# Altium project Power_vac.PrjPcb (part 2 of 2)

## Sheet Filtr_220.SchDoc
size B; SheetNumber: 8; SheetTotal: 9
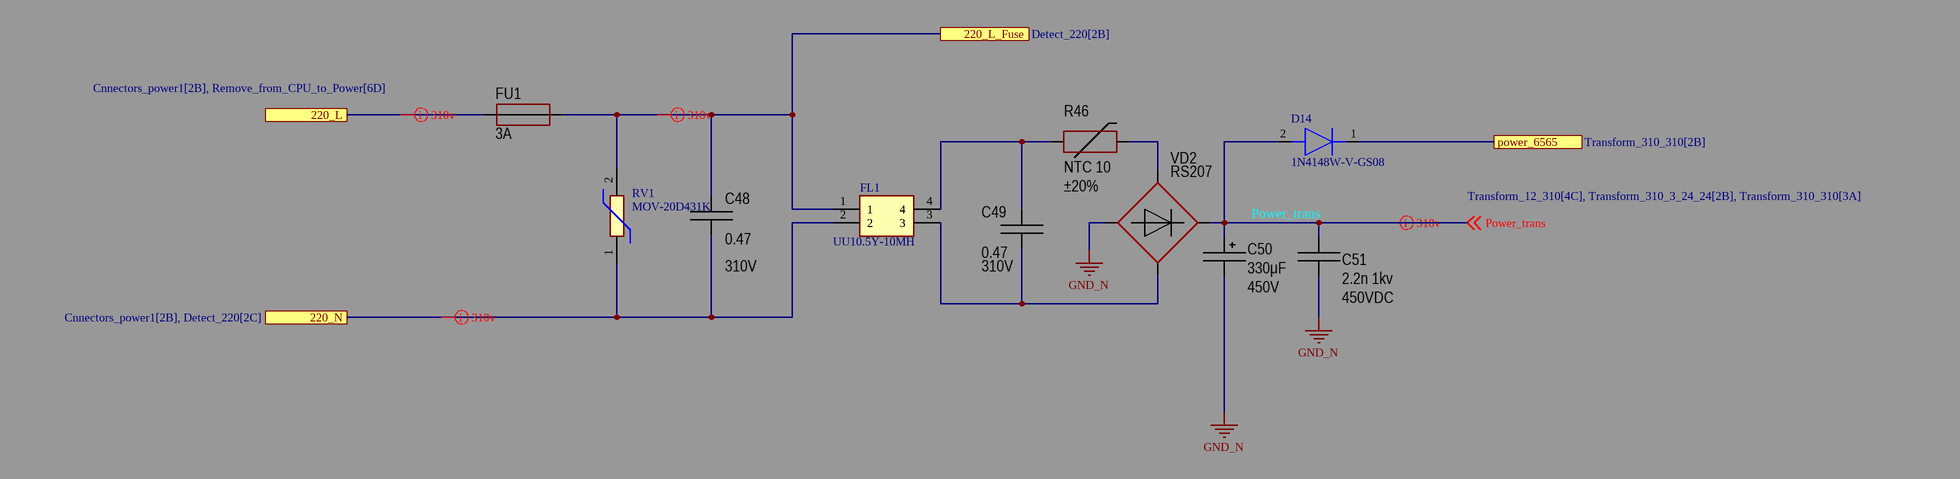
[diagram p7: Filtr_220.SchDoc]

### Parts
C48  value 0.47  Voltage: 310V  [CAP: B32922 (18x7x12.5mm)]
C49  value 0.47  Voltage: 310V  [CAP: B32922 (18x7x12.5mm)]
C50  value 330μF  Voltage: 450V  [CAP: D25C10H50]
C51  value 2.2n 1kv  Voltage: 450VDC  [CAP: AY2102M29Y5US63L7]
D14  1N4148W-V-GS08  [1N4148WVGS08]
FL1  UU10.5Y-10MH  [UU105Y10MH]
FU1  MaxCurrent: 3A  [FUSE: FC-001S]
R46  value NTC 10  Tolerance: ±20%  [RES: B57237 (NTC)]
RV1  MOV-20D431K  [MOV20D431K]
VD2  PartNumber: RS207  [DIODE: KBU6M]

### Ports
220_L (see Cnnectors_power1[2B], Remove_from_CPU_to_Power[6D]), 220_L_Fuse (see Detect_220[2B]), 220_N (see Cnnectors_power1[2B], Detect_220[2C]), power_6565 (see Transform_310_310[2B])

### Nets
GND_N: C50.2 C51.2 VD2.1
220_L: FU1.1 ; port 220_L
220_L_Fuse: C48.1 FL1.1 FU1.2 RV1.2 ; port 220_L_Fuse
220_N: C48.2 FL1.2 RV1.1 ; port 220_N
power_6565: D14.1(K) ; port power_6565
Power_trans: C50.1 C51.1 D14.2(A) VD2.3 ; off-sheet Power_trans
NetC49_1: C49.1 FL1.4 R46.1
NetC49_2: C49.2 FL1.3 VD2.4
NetR46_2: R46.2 VD2.2

### Layout directives
net class 310v: 220_L, 220_L_Fuse, 220_N, Power_trans

### Library data of the parts
C48 C49 = Film: Manufacturer: Epcos; PartNumber: B32774D4106K000; ValueManufacturerPartNumber: Film capacitor, 0.47, 310V, ±10%, 10.9mOhm, 31.5x15 mm, -40...+105°C; TypeCapacitor: Film capacitor; Tolerance: ±10%; Impedance: 10.9mOhm; Package: 31.5x15 mm; HelpURL: https://www.digikey.com/products/en/capacitors/film-capacitors/62?k=&pkeyword=&sv=0&pv2097=1958&sf=0&FV=fffc01ef%2C1f140000%2Cffe0003e%2Cffec6366&quantity=1&ColumnSort=1000011&page=1&stock=1&pageSize=25; Temperature: -40...+105°C
C50 = Aluminium: Manufacturer: Wurth; PartNumber: 860080475013; ValueManufacturerPartNumber: Aluminium capacitor, 330μF, 450V, ±20%, 54mOhm, 14x10x5 mm, -55...+105°C; TypeCapacitor: Aluminium capacitor; Tolerance: ±20%; Impedance: 54mOhm; Package: 14x10x5 mm; HelpURL: https://www.digikey.com/product-detail/en/wurth-electronics-inc/860080475013/732-9029-1-ND/5728972; Temperature: -55...+105°C
C51 = Film: Manufacturer: Epcos; PartNumber: B32774D4106K000; ValueManufacturerPartNumber: Film capacitor, 2.2n 1kv, 450VDC, ±10%, 10.9mOhm, 31.5x15 mm, -40...+105°C; TypeCapacitor: Film capacitor; Tolerance: ±10%; Impedance: 10.9mOhm; Package: 31.5x15 mm; HelpURL: https://www.digikey.com/products/en/capacitors/film-capacitors/62?k=&pkeyword=&sv=0&pv2097=1958&sf=0&FV=fffc01ef%2C1f140000%2Cffe0003e%2Cffec6366&quantity=1&ColumnSort=1000011&page=1&stock=1&pageSize=25; Temperature: -40...+105°C
D14 = 1N4148W-V-GS08: Diode; Manufacturer_Name: Vishay; Datasheet Link: https://us.rs-online.com/m/d/a2789c8794cb0c42ced29f2dd8571f3c.pdf; Height: 1.35mm; Manufacturer_Part_Number: 1N4148W-V-GS08; Mouser Part Number: 625-1N4148W-V; Mouser Price/Stock: https://www.mouser.co.uk/ProductDetail/Vishay-Semiconductors/1N4148W-V-GS08?qs=TNTIDjy6APrS%2Fdgq1RSs3A%3D%3D; Arrow Part Number: 1N4148W-V-GS08; Arrow Price/Stock: https://www.arrow.com/en/products/1n4148w-v-gs08/vishay
FL1 = UU10.5Y-10MH: Filter; Manufacturer_Name: FH(Guangdong Fenghua Advanced Tech); Datasheet Link: https://datasheet.lcsc.com/lcsc/2304140030_FH--Guangdong-Fenghua-Advanced-Tech-UU10-5Y-10mH_C75196.pdf; Height: 17mm; Manufacturer_Part_Number: UU10.5Y-10MH
FU1 = Fuse: Manufacturer: Littelfuse; PartNumber: 01110501Z; TypeFuse: Electromechanics relay; VoltageMax: 250VAC; Package: 5x20mm; HelpURL: https://www.digikey.com/products/en?keywords=01110501Z; ValueManufacturerPartNumber: =TypeFuse+', '+VoltageMax+', '+MaxCurrent+', '+Package+', '+Temperature
R46 = NTC: Manufacturer: Epcos; PartNumber: B57237S229M54; ValueManufacturerPartNumber: NTC resistor, NTC 10, ±20%, pitch 7.5mm, 7A, -55...+125°C; TypeResistor: NTC resistor; MaxCurrent: 7A; Package: pitch 7.5mm; HelpURL: https://www.digikey.com/product-detail/en/epcos-tdk/B57237S229M54/495-76635-1-ND/8126375; Temperature: -55...+125°C
RV1 = MOV-20D431K: Varistor; Manufacturer_Name: Bourns; Datasheet Link: https://www.bourns.com/data/global/pdfs/MOV20D.pdf; Height: 26mm; Manufacturer_Part_Number: MOV-20D431K; Mouser Part Number: 652-MOV-20D431K; Mouser Price/Stock: https://www.mouser.co.uk/ProductDetail/Bourns/MOV-20D431K?qs=CQ3B1E%252BbPs2R73OUL4kc5g%3D%3D; Arrow Part Number: MOV-20D431K; Arrow Price/Stock: https://www.arrow.com/en/products/mov-20d431k/bourns?utm_currency=USD&region=nac
VD2 = 1PH rectifier: Manufacturer: Comchip Technology; ValueManufacturerPartNumber: Single phase rectifier, 600V, 2A, 1.1V, 4-SMD, -55...+150°C; TypeDiode: Single phase rectifier; Voltage: 600V; Current: 2A; VoltageDrop: 1.1V; Package: 4-SMD; HelpURL: https://www.digikey.com/product-detail/en/comchip-technology/DF206ST-G/641-1425-1-ND/2208797; Temperature: -55...+150°C

## Sheet Remove_from_CPU_to_Power.SchDoc
size E; SheetNumber: 9; SheetTotal: 9
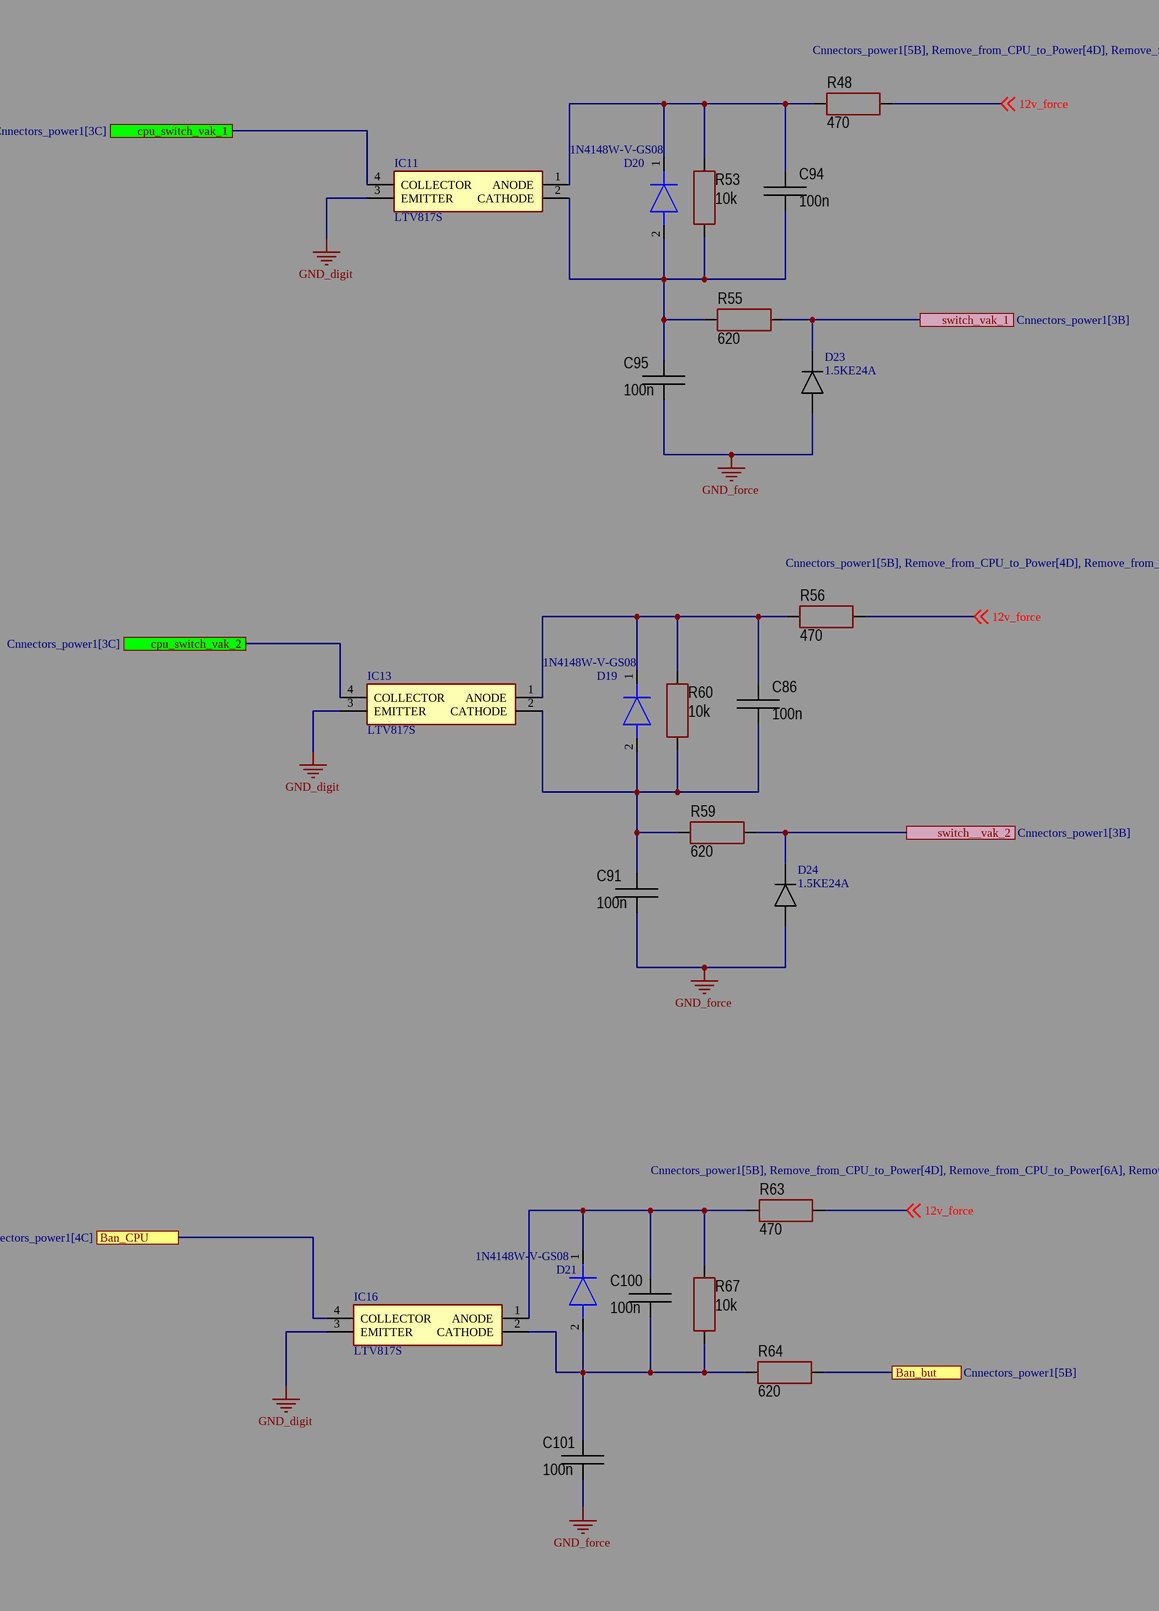
[diagram p8: Remove_from_CPU_to_Power.SchDoc, top left]
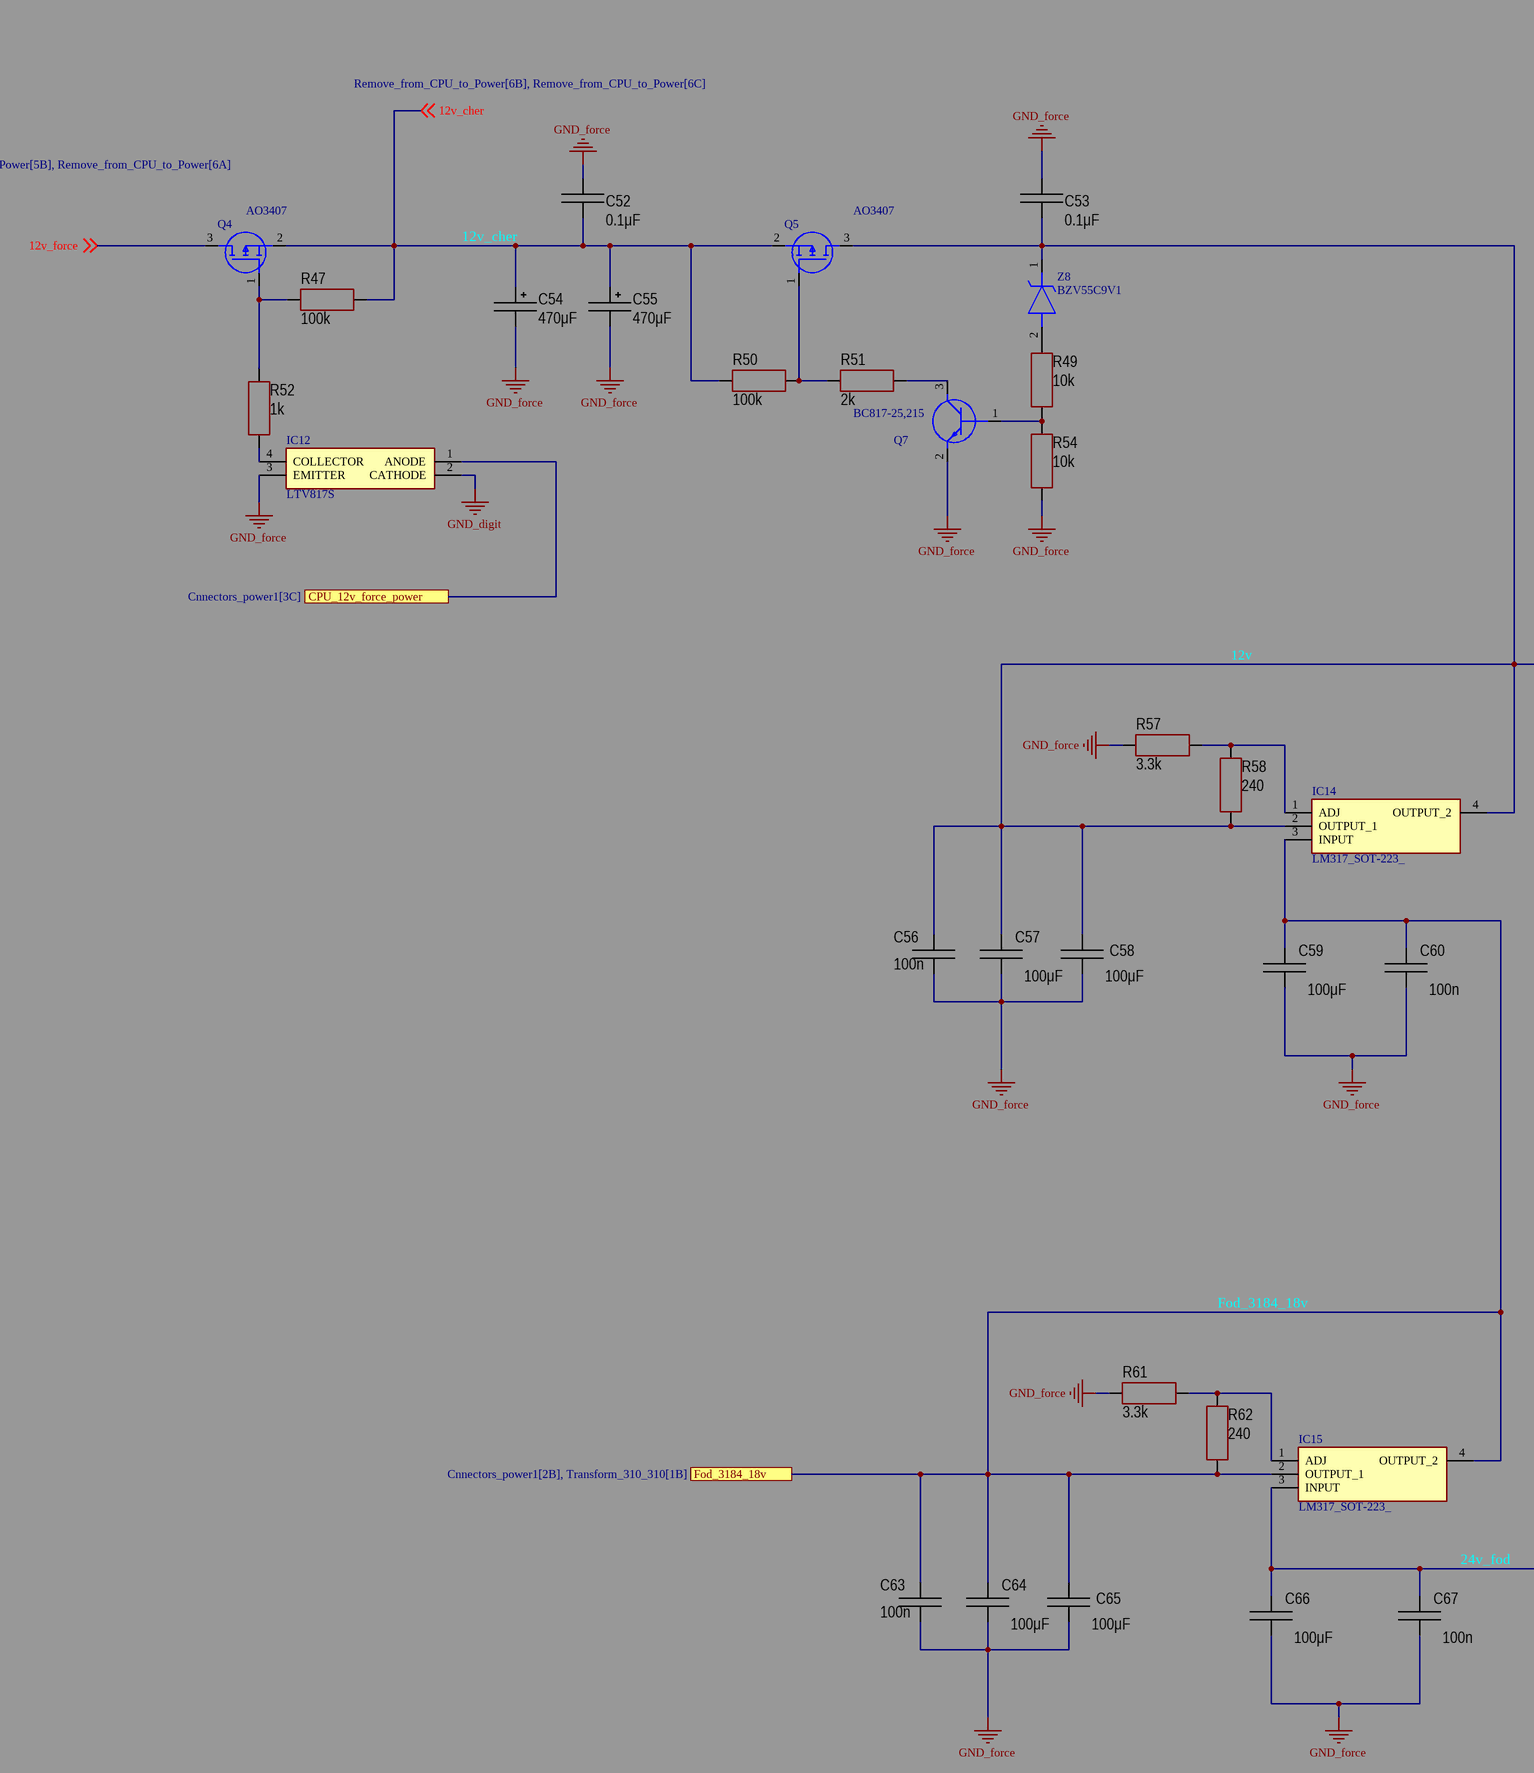
[diagram p9: Remove_from_CPU_to_Power.SchDoc, top middle]
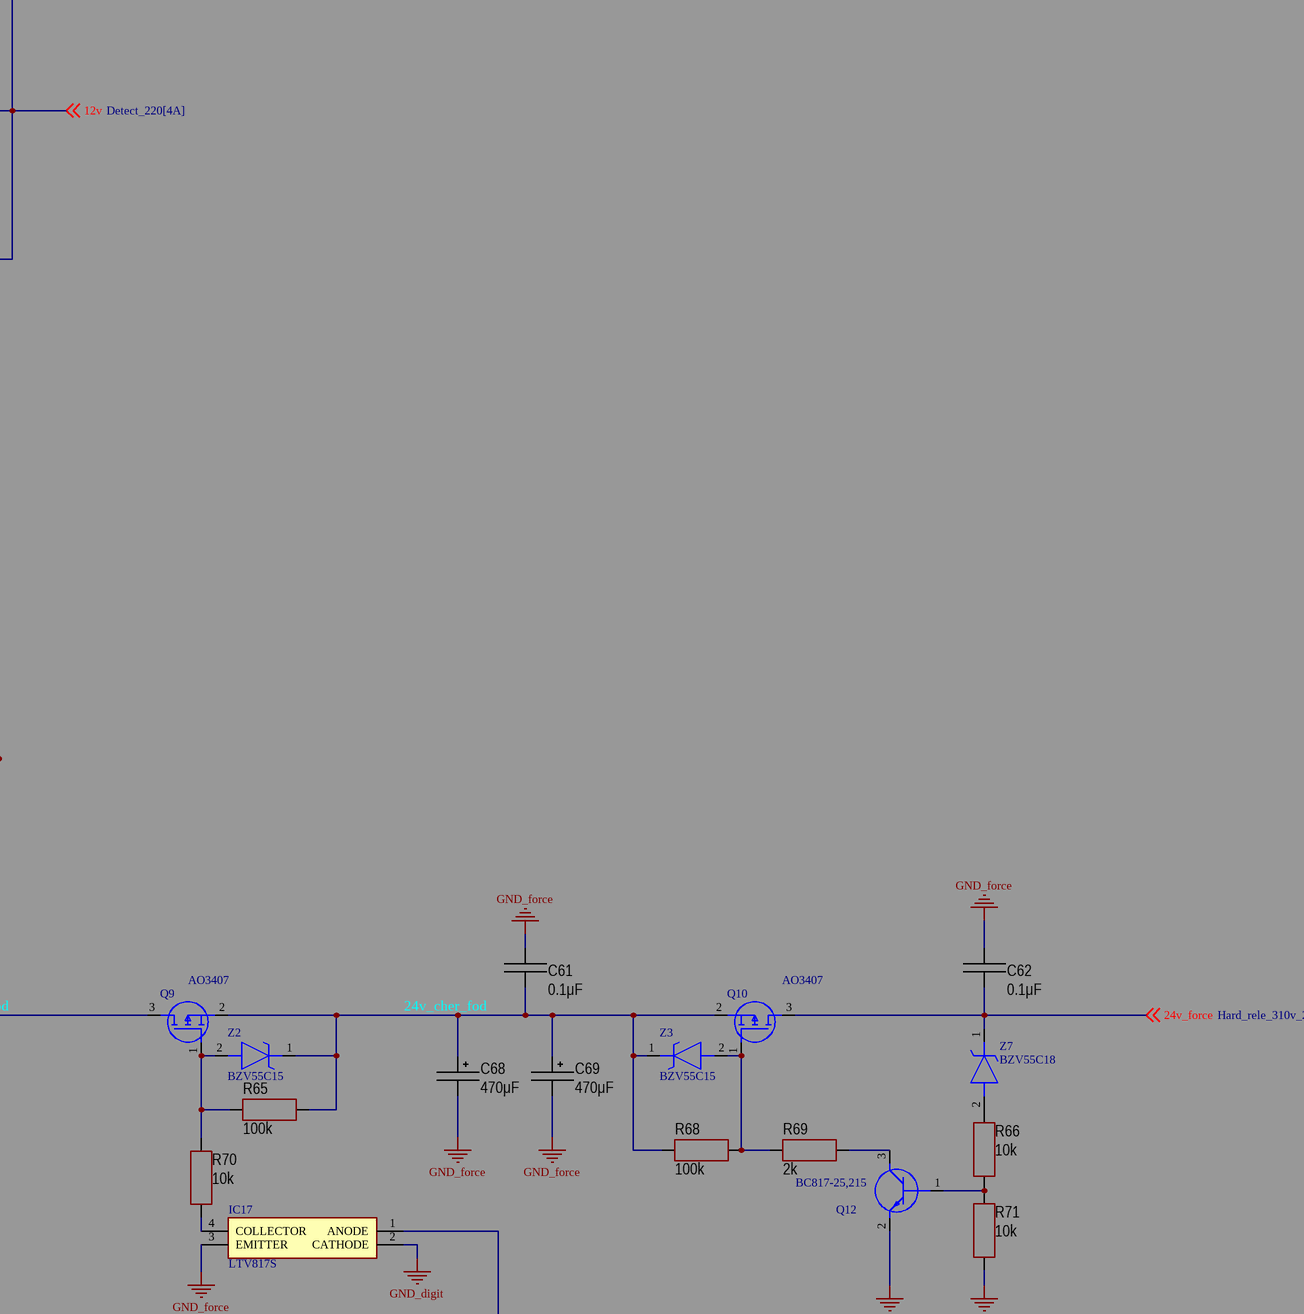
[diagram p10: Remove_from_CPU_to_Power.SchDoc, top right]
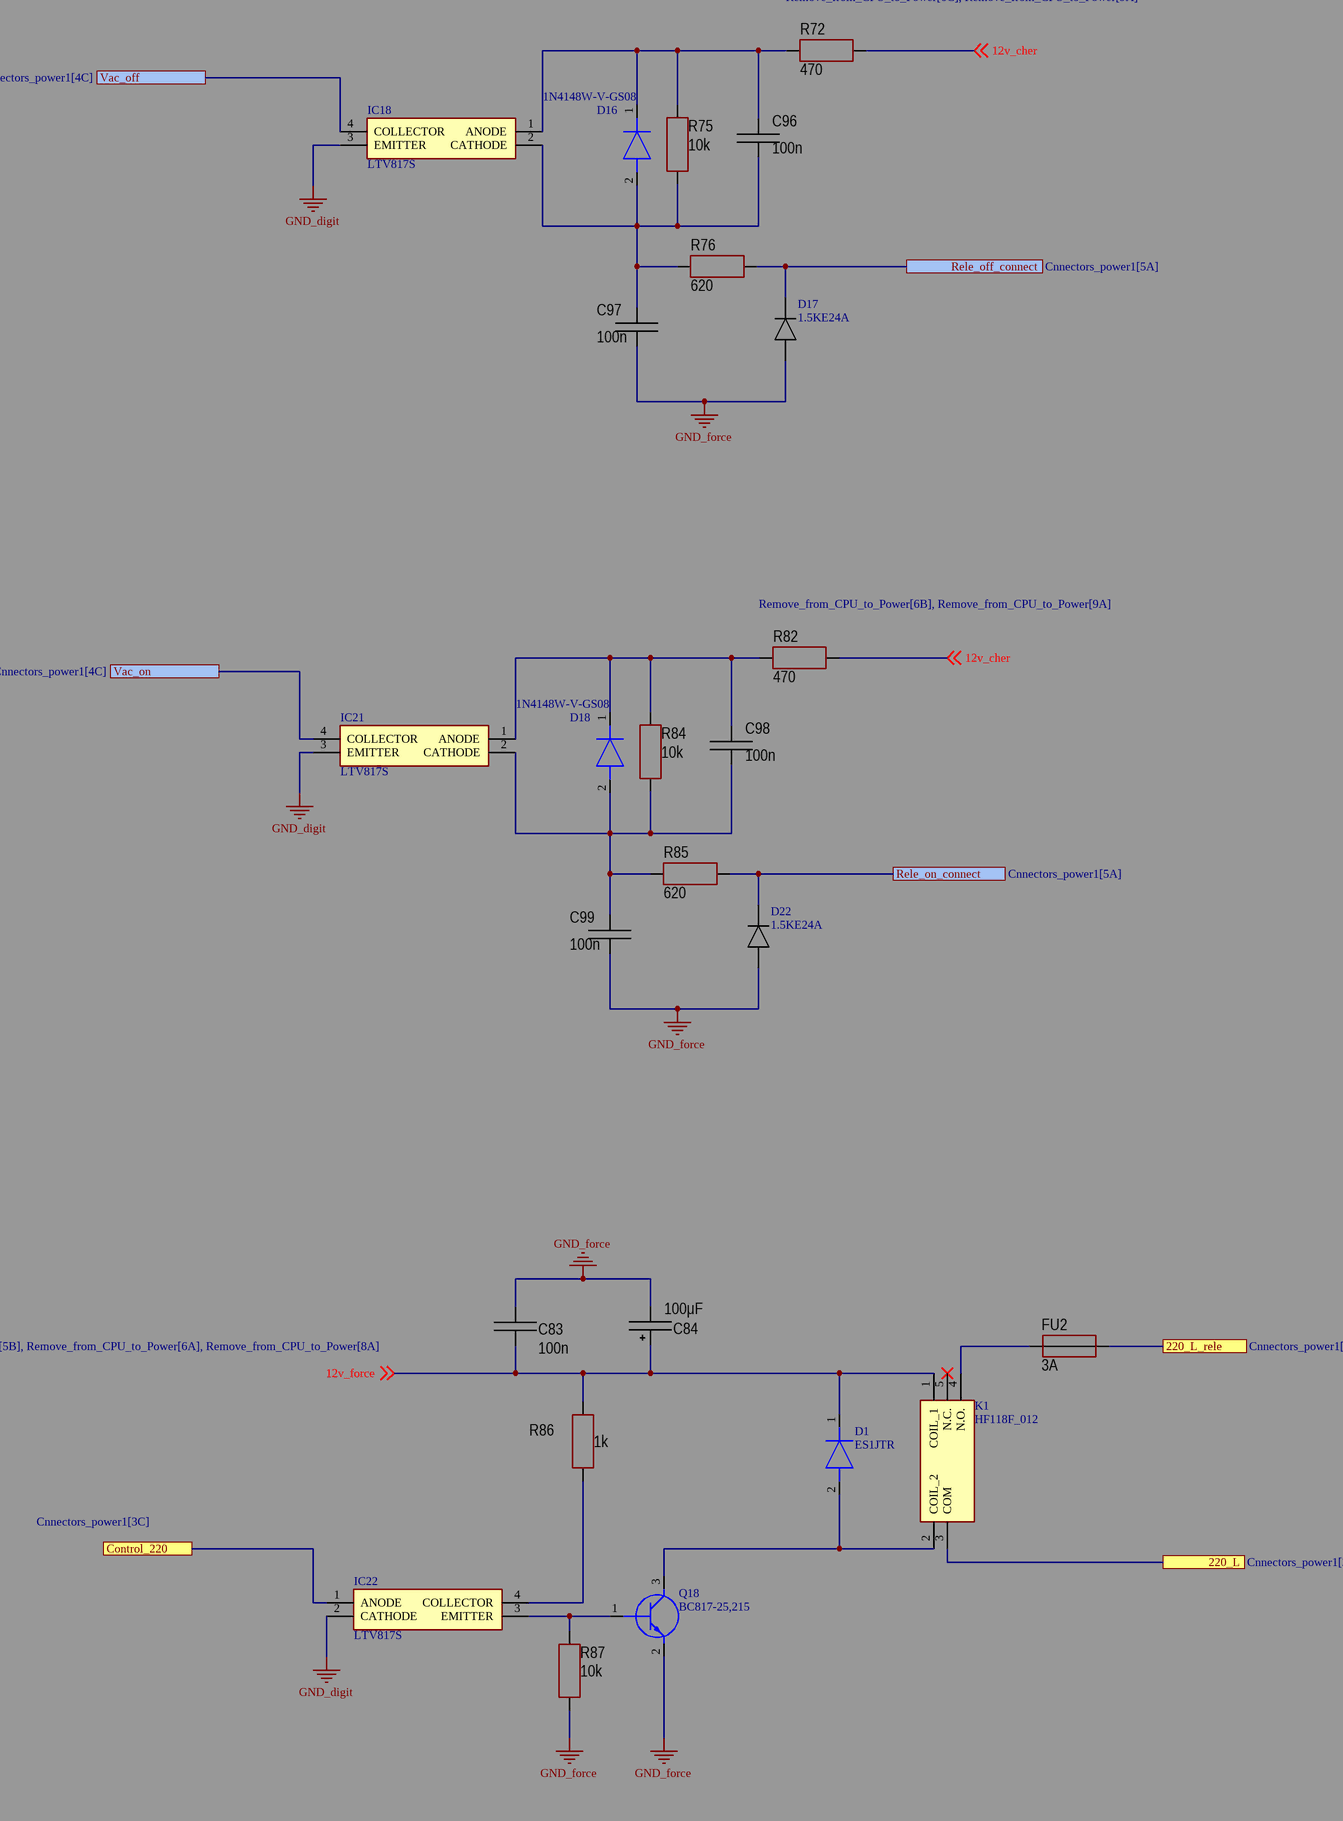
[diagram p11: Remove_from_CPU_to_Power.SchDoc, bottom left]
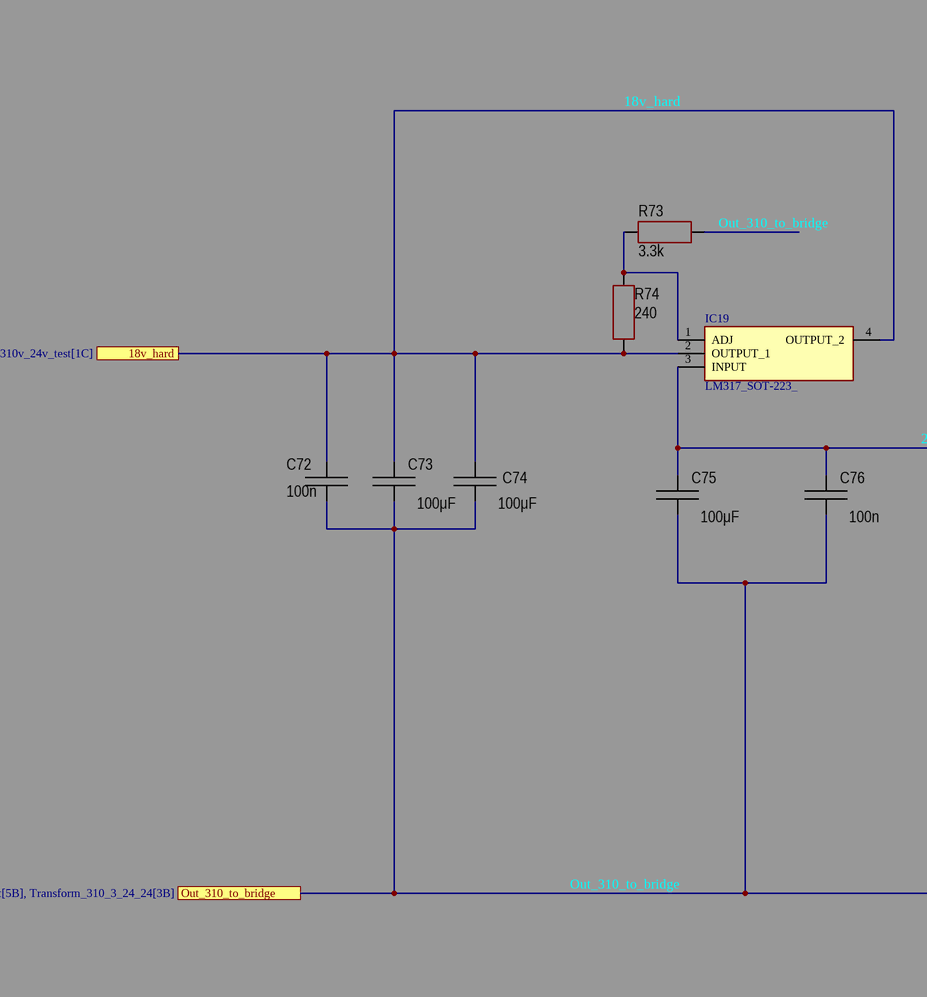
[diagram p12: Remove_from_CPU_to_Power.SchDoc, bottom middle]
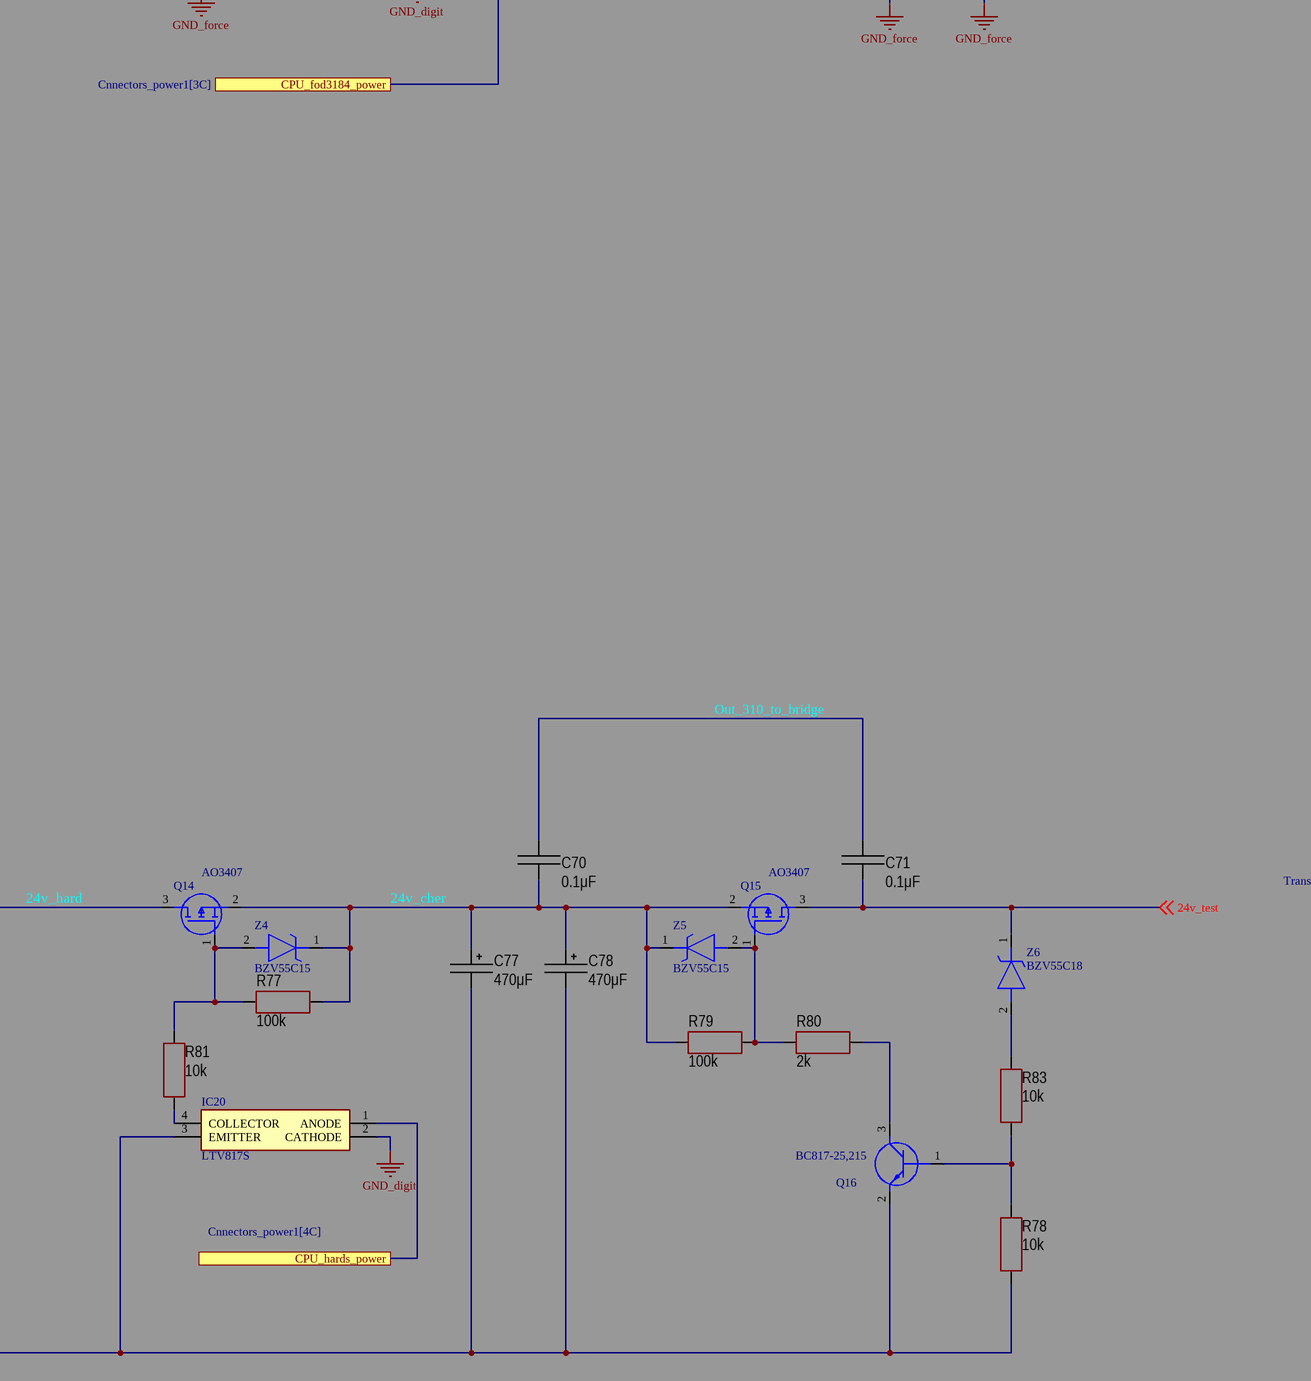
[diagram p13: Remove_from_CPU_to_Power.SchDoc, bottom right]

### Parts
C52  value 0.1μF  [CAP: 1206]
C53  value 0.1μF  [CAP: 1206]
C54  value 470μF  [CAP: D8C3.5H12]
C55  value 470μF  [CAP: D8C3.5H12]
C56  value 100n  [CAP: 1206]
C57  value 100μF  [CAP: 1206]
C58  value 100μF  [CAP: 1206]
C59  value 100μF  [CAP: 1206]
C60  value 100n  [CAP: 1206]
C61  value 0.1μF  [CAP: 1206]
C62  value 0.1μF  [CAP: 1206]
C63  value 100n  [CAP: 1206]
C64  value 100μF  [CAP: 1206]
C65  value 100μF  [CAP: 1206]
C66  value 100μF  [CAP: 1206]
C67  value 100n  [CAP: 1206]
C68  value 470μF  [CAP: D8C3.5H12]
C69  value 470μF  [CAP: D8C3.5H12]
C70  value 0.1μF  [CAP: 1206]
C71  value 0.1μF  [CAP: 1206]
C72  value 100n  [CAP: 1206]
C73  value 100μF  [CAP: 1206]
C74  value 100μF  [CAP: 1206]
C75  value 100μF  [CAP: 1206]
C76  value 100n  [CAP: 1206]
C77  value 470μF  [CAP: D8C3.5H12]
C78  value 470μF  [CAP: D8C3.5H12]
C83  value 100n  [CAP: 1206]
C84  value 100μF  [CAP: D8C3.5H12]
C86  value 100n  [CAP: 1206]
C91  value 100n  [CAP: 1206]
C94  value 100n  [CAP: 1206]
C95  value 100n  [CAP: 1206]
C96  value 100n  [CAP: 1206]
C97  value 100n  [CAP: 1206]
C98  value 100n  [CAP: 1206]
C99  value 100n  [CAP: 1206]
C100  value 100n  [CAP: 1206]
C101  value 100n  [CAP: 1206]
D1  ES1JTR  [DIOM5226X295N]
D16  1N4148W-V-GS08  [1N4148WVGS08]
D17  1.5KE24A  [THT_D_6mm_1]
D18  1N4148W-V-GS08  [1N4148WVGS08]
D19  1N4148W-V-GS08  [1N4148WVGS08]
D20  1N4148W-V-GS08  [1N4148WVGS08]
D21  1N4148W-V-GS08  [1N4148WVGS08]
D22  1.5KE24A  [THT_D_6mm_1]
D23  1.5KE24A  [THT_D_6mm_1]
D24  1.5KE24A  [THT_D_6mm_1]
FU2  MaxCurrent: 3A  [FUSE: FC-001S]
IC11  LTV817S  [SOP254P1016X460-4N]
IC12  LTV817S  [SOP254P1016X460-4N]
IC13  LTV817S  [SOP254P1016X460-4N]
IC14  LM317_SOT-223_  [SOT230P700X180-4N]
IC15  LM317_SOT-223_  [SOT230P700X180-4N]
IC16  LTV817S  [SOP254P1016X460-4N]
IC17  LTV817S  [SOP254P1016X460-4N]
IC18  LTV817S  [SOP254P1016X460-4N]
IC19  LM317_SOT-223_  [SOT230P700X180-4N]
IC20  LTV817S  [SOP254P1016X460-4N]
IC21  LTV817S  [SOP254P1016X460-4N]
IC22  LTV817S  [SOP254P1016X460-4N]
K1  HF118F_012  [HF118F0051ZS1T136]
Q4  AO3407  [SOT95P280X125-3N]
Q5  AO3407  [SOT95P280X125-3N]
Q7  BC817-25,215  [BC81725215]
Q9  AO3407  [SOT95P280X125-3N]
Q10  AO3407  [SOT95P280X125-3N]
Q12  BC817-25,215  [BC81725215]
Q14  AO3407  [SOT95P280X125-3N]
Q15  AO3407  [SOT95P280X125-3N]
Q16  BC817-25,215  [BC81725215]
Q18  BC817-25,215  [BC81725215]
R47  value 100k  [RES: 1206]
R48  value 470  [RES: 1206]
R49  value 10k  [RES: 1206]
R50  value 100k  [RES: 1206]
R51  value 2k  [RES: 1206]
R52  value 1k  [RES: 1206]
R53  value 10k  [RES: 1206]
R54  value 10k  [RES: 1206]
R55  value 620  [RES: 1206]
R56  value 470  [RES: 1206]
R57  value 3.3k  [RES: 1206]
R58  value 240  [RES: 1206]
R59  value 620  [RES: 1206]
R60  value 10k  [RES: 1206]
R61  value 3.3k  [RES: 1206]
R62  value 240  [RES: 1206]
R63  value 470  [RES: 1206]
R64  value 620  [RES: 1206]
R65  value 100k  [RES: 1206]
R66  value 10k  [RES: 1206]
R67  value 10k  [RES: 1206]
R68  value 100k  [RES: 1206]
R69  value 2k  [RES: 1206]
R70  value 10k  [RES: 1206]
R71  value 10k  [RES: 1206]
R72  value 470  [RES: 1206]
R73  value 3.3k  [RES: 1206]
R74  value 240  [RES: 1206]
R75  value 10k  [RES: 1206]
R76  value 620  [RES: 1206]
R77  value 100k  [RES: 1206]
R78  value 10k  [RES: 1206]
R79  value 100k  [RES: 1206]
R80  value 2k  [RES: 1206]
R81  value 10k  [RES: 1206]
R82  value 470  [RES: 1206]
R83  value 10k  [RES: 1206]
R84  value 10k  [RES: 1206]
R85  value 620  [RES: 1206]
R86  value 1k  [RES: 1206]
R87  value 10k  [RES: 1206]
Z2  BZV55C15  [DO-213AA]
Z3  BZV55C15  [DO-213AA]
Z4  BZV55C15  [DO-213AA]
Z5  BZV55C15  [DO-213AA]
Z6  BZV55C18  [BZV55C18]
Z7  BZV55C18  [BZV55C18]
Z8  BZV55C9V1  [BZV55C18]

### Ports
18v_hard (see Hard_rele_310v_24v_test[1C]), 220_L (see Cnnectors_power1[2B], Filtr_220[2B]), 220_L_rele (see Cnnectors_power1[3B]), Ban_but (see Cnnectors_power1[5B]), Ban_CPU (see Cnnectors_power1[4C]), Control_220 (see Cnnectors_power1[3C]), CPU_12v_force_power (see Cnnectors_power1[3C]), CPU_fod3184_power (see Cnnectors_power1[3C]), CPU_hards_power (see Cnnectors_power1[4C]), cpu_switch_vak_1 (see Cnnectors_power1[3C]), cpu_switch_vak_2 (see Cnnectors_power1[3C]), Fod_3184_18v (see Cnnectors_power1[2B], Transform_310_310[1B]), Out_310_to_bridge (see Cnnectors_power1[2A], Hard_rele_310v_24v_test[5B], Transform_310_3_24_24[3B]), Rele_off_connect (see Cnnectors_power1[5A]), Rele_on_connect (see Cnnectors_power1[5A]), switch__vak_2 (see Cnnectors_power1[3B]), switch_vak_1 (see Cnnectors_power1[3B]), Vac_off (see Cnnectors_power1[4C]), Vac_on (see Cnnectors_power1[4C])

### Nets
GND_digit: IC11.3(EMITTER) IC12.2(CATHODE) IC13.3(EMITTER) IC16.3(EMITTER) IC17.2(CATHODE) IC18.3(EMITTER) IC20.2(CATHODE) IC21.3(EMITTER) IC22.2(CATHODE)
GND_force: C52.1 C53.1 C54.2 C55.2 C56.1 C57.1 C58.1 C59.1 C60.1 C61.1 C62.1 C63.1 C64.1 C65.1 C66.1 C67.1 C68.2 C69.2 C83.1 C84.2 C91.1 C95.1 C97.1 C99.1 C101.1 D17.1 D22.1 D23.1 D24.1 IC12.3(EMITTER) IC17.3(EMITTER) Q7.2(E) Q12.2(E) Q18.2(E) R54.1 R57.1 R61.1 R71.1 R87.1
12v: C53.2 C56.2 C57.2 C58.2 IC14.2(OUTPUT_1) IC14.4(OUTPUT_2) Q5.3(D) R58.2 Z8.1(K) ; off-sheet 12v
12v_cher: C52.2 C54.1 C55.1 Q4.2(S) Q5.2(S) R47.1 R50.2 R72.2 R82.2 ; off-sheet 12v_cher
12v_force: C83.2 C84.1 D1.1(K) K1.1(COIL_1) Q4.3(D) R48.2 R56.2 R63.2 R86.2 ; off-sheet 12v_force
18v_hard: C72.2 C73.2 C74.2 IC19.2(OUTPUT_1) IC19.4(OUTPUT_2) R74.2 ; port 18v_hard
24v_cher: C70.2 C77.1 C78.1 Q14.2(S) Q15.2(S) R77.1 R79.2 Z4.1(K) Z5.1(K)
24v_cher_fod: C61.2 C68.1 C69.1 Q9.2(S) Q10.2(S) R65.1 R68.2 Z2.1(K) Z3.1(K)
24v_fod: C66.2 C67.2 IC15.3(INPUT) Q9.3(D)
24v_force: C62.2 Q10.3(D) Z7.1(K) ; off-sheet 24v_force
24v_hard: C75.2 C76.2 IC19.3(INPUT) Q14.3(D)
24v_test: C71.2 Q15.3(D) Z6.1(K) ; off-sheet 24v_test
220_L: K1.3(COM) ; port 220_L
220_L_rele: FU2.2 ; port 220_L_rele
Ban_but: R64.1 ; port Ban_but
Ban_CPU: IC16.4(COLLECTOR) ; port Ban_CPU
Control_220: IC22.1(ANODE) ; port Control_220
CPU_12v_force_power: IC12.1(ANODE) ; port CPU_12v_force_power
CPU_fod3184_power: IC17.1(ANODE) ; port CPU_fod3184_power
CPU_hards_power: IC20.1(ANODE) ; port CPU_hards_power
cpu_switch_vak_1: IC11.4(COLLECTOR) ; port cpu_switch_vak_1
cpu_switch_vak_2: IC13.4(COLLECTOR) ; port cpu_switch_vak_2
Fod_3184_18v: C59.2 C60.2 C63.2 C64.2 C65.2 IC14.3(INPUT) IC15.2(OUTPUT_1) IC15.4(OUTPUT_2) R62.2 ; port Fod_3184_18v
Out_310_to_bridge: C70.1 C71.1 C72.1 C73.1 C74.1 C75.1 C76.1 C77.2 C78.2 IC20.3(EMITTER) Q16.2(E) R73.1 R78.1 ; port Out_310_to_bridge
Rele_off_connect: D17.2 R76.1 ; port Rele_off_connect
Rele_on_connect: D22.2 R85.1 ; port Rele_on_connect
switch__vak_2: D24.2 R59.1 ; port switch__vak_2
switch_vak_1: D23.2 R55.1 ; port switch_vak_1
Vac_off: IC18.4(COLLECTOR) ; port Vac_off
Vac_on: IC21.4(COLLECTOR) ; port Vac_on
NetC86_1: C86.1 C91.2 D19.2(A) IC13.2(CATHODE) R59.2 R60.1
NetC86_2: C86.2 D19.1(K) IC13.1(ANODE) R56.1 R60.2
NetC94_1: C94.1 C95.2 D20.2(A) IC11.2(CATHODE) R53.1 R55.2
NetC94_2: C94.2 D20.1(K) IC11.1(ANODE) R48.1 R53.2
NetC96_1: C96.1 C97.2 D16.2(A) IC18.2(CATHODE) R75.1 R76.2
NetC96_2: C96.2 D16.1(K) IC18.1(ANODE) R72.1 R75.2
NetC98_1: C98.1 C99.2 D18.2(A) IC21.2(CATHODE) R84.1 R85.2
NetC98_2: C98.2 D18.1(K) IC21.1(ANODE) R82.1 R84.2
NetC100_1: C100.1 C101.2 D21.2(A) IC16.2(CATHODE) R64.2 R67.1
NetC100_2: C100.2 D21.1(K) IC16.1(ANODE) R63.1 R67.2
NetD1_2: D1.2(A) K1.2(COIL_2) Q18.3(C)
NetFU2_1: FU2.1 K1.4(N.O.)
NetIC12_4: IC12.4(COLLECTOR) R52.1
NetIC14_1: IC14.1(ADJ) R57.2 R58.1
NetIC15_1: IC15.1(ADJ) R61.2 R62.1
NetIC17_4: IC17.4(COLLECTOR) R70.1
NetIC19_1: IC19.1(ADJ) R73.2 R74.1
NetIC20_4: IC20.4(COLLECTOR) R81.1
NetIC22_3: IC22.3(EMITTER) Q18.1(B) R87.2
NetIC22_4: IC22.4(COLLECTOR) R86.1
NetQ4_1: Q4.1(G) R47.2 R52.2
NetQ5_1: Q5.1(G) R50.1 R51.2
NetQ7_1: Q7.1(B) R49.1 R54.2
NetQ7_3: Q7.3(C) R51.1
NetQ9_1: Q9.1(G) R65.2 R70.2 Z2.2(A)
NetQ10_1: Q10.1(G) R68.1 R69.2 Z3.2(A)
NetQ12_1: Q12.1(B) R66.1 R71.2
NetQ12_3: Q12.3(C) R69.1
NetQ14_1: Q14.1(G) R77.2 R81.2 Z4.2(A)
NetQ15_1: Q15.1(G) R79.1 R80.2 Z5.2(A)
NetQ16_1: Q16.1(B) R78.2 R83.1
NetQ16_3: Q16.3(C) R80.1
NetR49_2: R49.2 Z8.2(A)
NetR66_2: R66.2 Z7.2(A)
NetR83_2: R83.2 Z6.2(A)

Not connected (* = marked no-connect by the designer): K1 5(N.C.)*

### Library data of the parts
C52 C53 C61 C62 C70 C71 = Ceramic_1206: Manufacturer: Yageo; PartNumber: CC1206KRX7R9BB104; ValueManufacturerPartNumber: Ceramic capacitor, 0.1μF, X7R, ±10%, 50V, 1206, -55...+125°C; TypeCapacitor: Ceramic capacitor; Tolerance: ±10%; TypeDielectric: X7R; Voltage: 50V; Package: 1206; HelpURL: https://www.digikey.com/product-detail/en/yageo/CC1206KRX7R9BB104/311-1179-1-ND/303089; Temperature: -55...+125°C
C54 C55 C68 C69 C77 C78 = Aluminium: Manufacturer: Wurth; PartNumber: 860080475013; ValueManufacturerPartNumber: Aluminium capacitor, 470μF, 25V, ±20%, 54mOhm, 14x10x5 mm, -55...+105°C; TypeCapacitor: Aluminium capacitor; Tolerance: ±20%; Impedance: 54mOhm; Voltage: 25V; Package: 14x10x5 mm; HelpURL: https://www.digikey.com/product-detail/en/wurth-electronics-inc/860080475013/732-9029-1-ND/5728972; Temperature: -55...+105°C
C56 C60 C63 C67 C72 C76 C83 C86 C91 C94-C101 = Ceramic_1206: Manufacturer: Yageo; PartNumber: CC1206KRX7R9BB104; ValueManufacturerPartNumber: Ceramic capacitor, 100n, X7R, ±10%, 50V, 1206, -55...+125°C; TypeCapacitor: Ceramic capacitor; Tolerance: ±10%; TypeDielectric: X7R; Voltage: 50V; Package: 1206; HelpURL: https://www.digikey.com/product-detail/en/yageo/CC1206KRX7R9BB104/311-1179-1-ND/303089; Temperature: -55...+125°C
C57-C59 C64-C66 C73-C75 = Ceramic_1206: Manufacturer: Yageo; PartNumber: CC1206KRX7R9BB104; ValueManufacturerPartNumber: Ceramic capacitor, 100μF, X7R, ±10%, 50V, 1206, -55...+125°C; TypeCapacitor: Ceramic capacitor; Tolerance: ±10%; TypeDielectric: X7R; Voltage: 50V; Package: 1206; HelpURL: https://www.digikey.com/product-detail/en/yageo/CC1206KRX7R9BB104/311-1179-1-ND/303089; Temperature: -55...+125°C
C84 = Aluminium: Manufacturer: Wurth; PartNumber: 860080475013; ValueManufacturerPartNumber: Aluminium capacitor, 100μF, 25v, ±20%, 54mOhm, 14x10x5 mm, -55...+105°C; TypeCapacitor: Aluminium capacitor; Tolerance: ±20%; Impedance: 54mOhm; Voltage: 25v; Package: 14x10x5 mm; HelpURL: https://www.digikey.com/product-detail/en/wurth-electronics-inc/860080475013/732-9029-1-ND/5728972; Temperature: -55...+105°C
D1 = ES1JTR: Diode; Manufacturer_Name: SMC Diode Solutions; Datasheet Link: http://www.smc-diodes.com/propdf/ES1(A-M)%20N0159%20REV.E.pdf; Height: 2.95mm; Manufacturer_Part_Number: ES1JTR
D16 D18-D21 = 1N4148W-V-GS08: Diode; Manufacturer_Name: Vishay; Datasheet Link: https://us.rs-online.com/m/d/a2789c8794cb0c42ced29f2dd8571f3c.pdf; Height: 1.35mm; Manufacturer_Part_Number: 1N4148W-V-GS08; Mouser Part Number: 625-1N4148W-V; Mouser Price/Stock: https://www.mouser.co.uk/ProductDetail/Vishay-Semiconductors/1N4148W-V-GS08?qs=TNTIDjy6APrS%2Fdgq1RSs3A%3D%3D; Arrow Part Number: 1N4148W-V-GS08; Arrow Price/Stock: https://www.arrow.com/en/products/1n4148w-v-gs08/vishay
D17 D22-D24 = THT_D_6mm_1
FU2 = Fuse: as FU1 on sheet Filtr_220; Package: 5x20mm; HelpURL: https://www.digikey.com/products/en?keywords=01110501Z; ValueManufacturerPartNumber: =TypeFuse+', '+VoltageMax+', '+MaxCurrent+', '+Package+', '+Temperature
IC11-IC13 IC16-IC18 IC20-IC22 = LTV817S: Integrated Circuit; Manufacturer_Name: Lite-On; Datasheet Link: https://www.arrow.com/en/products/ltv-817s/lite-on-technology; Height: 4.6mm; Manufacturer_Part_Number: LTV817S; Arrow Part Number: LTV817S; Arrow Price/Stock: https://www.arrow.com/en/products/ltv-817s/lite-on-technology
IC14 IC15 IC19 = LM317_SOT-223_: Integrated Circuit; Manufacturer_Name: Changjiang Electronics Tech (CJ); Manufacturer_Part_Number: LM317(SOT-223); Datasheet Link: https://www.jscj-elec.com/gallery//file/LM317%20SOT-223%20%20V2.0.pdf; Height: 1.8mm
K1 = HF118F_005-1ZS1T_136_: Relay or Contactor; Manufacturer_Name: Hongfa; Manufacturer_Part_Number: HF118F/005-1ZS1T(136); Height: 12.8mm
Q4 Q5 Q9 Q10 Q14 Q15 = AO3401A: MOSFET (P-Channel); Manufacturer_Name: Alpha & Omega Semiconductors; Datasheet Link: http://www.aosmd.com/pdfs/datasheet/AO3401A.pdf; Height: 1.25mm; Manufacturer_Part_Number: AO3401A; Arrow Part Number: AO3401A; Arrow Price/Stock: https://www.arrow.com/en/products/ao3401a/alpha-and-omega-semiconductor?utm_currency=USD&region=nac
Q7 Q12 Q16 Q18 = BC817-25,215: Transistor BJT NPN; Manufacturer_Name: Nexperia; Datasheet Link: https://assets.nexperia.com/documents/data-sheet/BC817_SER.pdf; Height: 1.1mm; Manufacturer_Part_Number: BC817-25,215; Mouser Part Number: 771-BC817-25-T/R; Mouser Price/Stock: https://www.mouser.co.uk/ProductDetail/Nexperia/BC817-25215?qs=me8TqzrmIYUj67JkTBzlfg%3D%3D; Arrow Part Number: BC817-25,215; Arrow Price/Stock: https://www.arrow.com/en/products/bc817-25215/nexperia?region=nac
R47 R50 R65 R68 R77 R79 = Resistor_1206: Manufacturer: Yageo; PartNumber: RC1206JR-07100RL; ValueManufacturerPartNumber: Resistor film, 100k, ±5%, 1206, 0.25W, -55...+125°C; TypeResistor: Resistor film; Power: 0.25W; Tolerance: ±5%; Package: 1206; HelpURL: https://www.digikey.com/product-detail/en/yageo/RC1206JR-07100RL/311-100ERCT-ND/732153; Temperature: -55...+125°C
R48 R56 R63 R72 R82 = Resistor_1206: Manufacturer: Yageo; PartNumber: RC1206JR-07100RL; ValueManufacturerPartNumber: Resistor film, 470, ±5%, 1206, 0.25W, -55...+125°C; TypeResistor: Resistor film; Power: 0.25W; Tolerance: ±5%; Package: 1206; HelpURL: https://www.digikey.com/product-detail/en/yageo/RC1206JR-07100RL/311-100ERCT-ND/732153; Temperature: -55...+125°C
R49 R53 R54 R60 R66 R67 R70 R71 R75 R78 R81 R83 R84 R87 = Resistor_1206: Manufacturer: Yageo; PartNumber: RC1206JR-07100RL; ValueManufacturerPartNumber: Resistor film, 10k, ±5%, 1206, 0.25W, -55...+125°C; TypeResistor: Resistor film; Power: 0.25W; Tolerance: ±5%; Package: 1206; HelpURL: https://www.digikey.com/product-detail/en/yageo/RC1206JR-07100RL/311-100ERCT-ND/732153; Temperature: -55...+125°C
R51 R69 R80 = Resistor_1206: Manufacturer: Yageo; PartNumber: RC1206JR-07100RL; ValueManufacturerPartNumber: Resistor film, 2k, ±5%, 1206, 0.25W, -55...+125°C; TypeResistor: Resistor film; Power: 0.25W; Tolerance: ±5%; Package: 1206; HelpURL: https://www.digikey.com/product-detail/en/yageo/RC1206JR-07100RL/311-100ERCT-ND/732153; Temperature: -55...+125°C
R52 R86 = Resistor_1206: Manufacturer: Yageo; PartNumber: RC1206JR-07100RL; ValueManufacturerPartNumber: Resistor film, 1k, ±5%, 1206, 0.25W, -55...+125°C; TypeResistor: Resistor film; Power: 0.25W; Tolerance: ±5%; Package: 1206; HelpURL: https://www.digikey.com/product-detail/en/yageo/RC1206JR-07100RL/311-100ERCT-ND/732153; Temperature: -55...+125°C
R55 R59 R64 R76 R85 = Resistor_1206: Manufacturer: Yageo; PartNumber: RC1206JR-07100RL; ValueManufacturerPartNumber: Resistor film, 620, ±5%, 1206, 0.25W, -55...+125°C; TypeResistor: Resistor film; Power: 0.25W; Tolerance: ±5%; Package: 1206; HelpURL: https://www.digikey.com/product-detail/en/yageo/RC1206JR-07100RL/311-100ERCT-ND/732153; Temperature: -55...+125°C
R57 R61 R73 = Resistor_1206: Manufacturer: Yageo; PartNumber: RC1206JR-07100RL; ValueManufacturerPartNumber: Resistor film, 3.3k, ±5%, 1206, 0.25W, -55...+125°C; TypeResistor: Resistor film; Power: 0.25W; Tolerance: ±5%; Package: 1206; HelpURL: https://www.digikey.com/product-detail/en/yageo/RC1206JR-07100RL/311-100ERCT-ND/732153; Temperature: -55...+125°C
R58 R62 R74 = Resistor_1206: Manufacturer: Yageo; PartNumber: RC1206JR-07100RL; ValueManufacturerPartNumber: Resistor film, 240, ±5%, 1206, 0.25W, -55...+125°C; TypeResistor: Resistor film; Power: 0.25W; Tolerance: ±5%; Package: 1206; HelpURL: https://www.digikey.com/product-detail/en/yageo/RC1206JR-07100RL/311-100ERCT-ND/732153; Temperature: -55...+125°C
Z2-Z5 = BZV55C15: Zener Diode; Manufacturer_Name: Microsemi Corporation; Datasheet Link: https://www.mouser.com/datasheet/2/268/BZV55_C2V4_C75-1593780.pdf; Manufacturer_Part_Number: BZV55C15; Mouser Part Number: 494-BZV55C15; Mouser Price/Stock: https://www.mouser.co.uk/ProductDetail/Microchip-Microsemi/BZV55C15/?qs=TXMzd3F6Eykee5C9dglsnA%3D%3D; Arrow Part Number: BZV55C15; Arrow Price/Stock: https://www.arrow.com/en/products/bzv55c15/microsemi
Z6-Z8 = BZV55C18: Zener Diode; Manufacturer_Name: Microchip; Datasheet Link: https://www.microsemi.com/document-portal/doc_download/8298-bzv55-c2v4-c75-datasheet; Height: 1.7mm; Manufacturer_Part_Number: BZV55C18; Mouser Part Number: 494-BZV55C18; Mouser Price/Stock: https://www.mouser.co.uk/ProductDetail/Microchip-Technology/BZV55C18?qs=w%2Fv1CP2dgqosS2q5rh%252BhPQ%3D%3D; Arrow Part Number: BZV55C18; Arrow Price/Stock: https://www.arrow.com/en/products/bzv55c18/microchip-technology.html?utm_currency=USD&region=nac

## Nets that join several sheets
GND_akum: Cnnectors_power1 (Buster_1.1), Transform_12_310 (32 pins)
GND_digit: Hard_rele_310v_24v_test (IC1.3 IC2.3 R2.1 R6.1), Cnnectors_power1 (9 pins), Transform_310_3_24_24 (C85.1 PS3.4), Detect_220 (6 pins), Remove_from_CPU_to_Power (9 pins)
GND_force: Capasitors_vac (14 pins), Hard_rele_310v_24v_test (VD1.1), Cnnectors_power1 (10 pins), Transform_310_310 (8 pins), Transform_310_3_24_24 (PS1.3), Detect_220 (C15.1 IC9.2 R98.2), Remove_from_CPU_to_Power (39 pins)
GND_N: Transform_12_310 (C92.2 D6.2 D7.2), Transform_310_310 (15 pins), Transform_310_3_24_24 (PS1.2 PS2.2 PS3.2), Filtr_220 (C50.2 C51.2 VD2.1)
3.3v_digit: Cnnectors_power1 (CPU.1), Transform_310_3_24_24 (C85.2 PS3.3), Detect_220 (C16.2 IC9.4 R93.2 R94.2)
12v: Detect_220 (R97.2), Remove_from_CPU_to_Power (9 pins)
12v_akum: Cnnectors_power1 (Buster_1.2), Transform_12_310 (12 pins)
12v_force: Cnnectors_power1 (Ban.1), Remove_from_CPU_to_Power (9 pins)
18v_hard: Hard_rele_310v_24v_test (D2.2 D4.2), Remove_from_CPU_to_Power (6 pins)
24v_force: Hard_rele_310v_24v_test (R4.1), Transform_310_3_24_24 (PS1.4), Remove_from_CPU_to_Power (C62.2 Q10.3 Z7.1)
24v_test: Transform_310_3_24_24 (PS2.4), Remove_from_CPU_to_Power (C71.2 Q15.3 Z6.1)
220_L: Cnnectors_power1 (220.1), Filtr_220 (FU1.1), Remove_from_CPU_to_Power (K1.3)
220_L_Fuse: Detect_220 (R43.1), Filtr_220 (C48.1 FL1.1 FU1.2 RV1.2)
220_L_rele: Cnnectors_power1 (rele220_out.2), Remove_from_CPU_to_Power (FU2.2)
220_N: Cnnectors_power1 (220.3 rele220_out.1), Detect_220 (R45.1), Filtr_220 (C48.2 FL1.2 RV1.1)
310v: Capasitors_vac (14 pins), Hard_rele_310v_24v_test (VT1.2), Transform_310_310 (D9.1 R33.2)
Ban_but: Cnnectors_power1 (Ban.2), Remove_from_CPU_to_Power (R64.1)
Ban_CPU: Cnnectors_power1 (CPU.19), Remove_from_CPU_to_Power (IC16.4)
Check_220_power: Cnnectors_power1 (CPU.20), Detect_220 (Q20.3 R94.1)
Check_220_power_to_12v_transform: Transform_12_310 (5 pins), Detect_220 (IC10.3)
Control_220: Cnnectors_power1 (CPU.12), Remove_from_CPU_to_Power (IC22.1)
CPU_12v_force_power: Cnnectors_power1 (CPU.2), Remove_from_CPU_to_Power (IC12.1)
CPU_fod3184_power: Cnnectors_power1 (CPU.6), Remove_from_CPU_to_Power (IC17.1)
CPU_hards_power: Cnnectors_power1 (CPU.13), Remove_from_CPU_to_Power (IC20.1)
cpu_switch_vak_1: Cnnectors_power1 (CPU.14), Remove_from_CPU_to_Power (IC11.4)
cpu_switch_vak_2: Cnnectors_power1 (CPU.16), Remove_from_CPU_to_Power (IC13.4)
Fod_3184_18v: Cnnectors_power1 (fod3184_+18v.1), Transform_310_310 (C42.1 R30.1 R89.1), Remove_from_CPU_to_Power (9 pins)
On_off_hard_rele_24v_test: Hard_rele_310v_24v_test (IC2.2 R6.2), Cnnectors_power1 (CPU.15)
On_off_hard_rele_310v: Hard_rele_310v_24v_test (IC1.2 R2.2), Cnnectors_power1 (CPU.10)
Out_310_to_bridge: Hard_rele_310v_24v_test (13 pins), Cnnectors_power1 (+310_bridge.1), Transform_310_3_24_24 (PS2.3), Remove_from_CPU_to_Power (13 pins)
power_6565: Transform_310_310 (R27.1), Filtr_220 (D14.1)
Power_trans: Transform_12_310 (D5.1 D8.1), Transform_310_310 (C41.1 R26.2 R37.1 T2.1), Transform_310_3_24_24 (PS1.1 PS2.1 PS3.1), Filtr_220 (C50.1 C51.1 D14.2 VD2.3)
Rele_off_connect: Cnnectors_power1 (C80.2 on-off1.1), Remove_from_CPU_to_Power (D17.2 R76.1)
Rele_on_connect: Cnnectors_power1 (C79.2 on-off1.3), Remove_from_CPU_to_Power (D22.2 R85.1)
switch__vak_2: Cnnectors_power1 (C82.1 switch_vak1.4), Remove_from_CPU_to_Power (D24.2 R59.1)
switch_vak_1: Cnnectors_power1 (C81.2 switch_vak1.1), Remove_from_CPU_to_Power (D23.2 R55.1)
Vac_off: Cnnectors_power1 (CPU.9), Remove_from_CPU_to_Power (IC18.4)
Vac_on: Cnnectors_power1 (CPU.5), Remove_from_CPU_to_Power (IC21.4)
Vref: Transform_12_310 (7 pins), Detect_220 (R44.2)